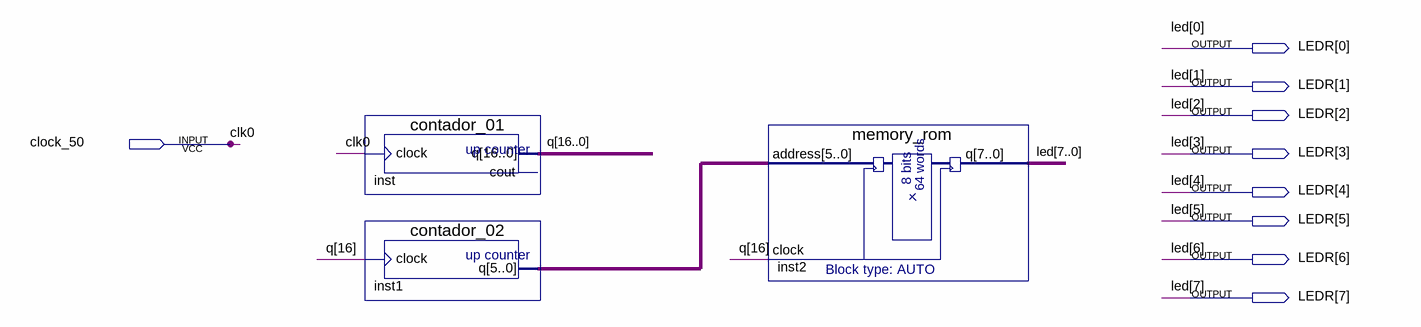
[diagram p0: schematic sheet]
// Quartus schematic lab_04A.bdf as structural Verilog: 3 symbols, 9 pins
module lab_04A (
  input  clock_50,
  output [7:0] LEDR
);

  wire [5:0] inst1_q;
  wire [16:0] q;

  contador_01 inst (.clock(clock_50), .q(q));  // open: cout
  contador_02 inst1 (.clock(q[16]), .q(inst1_q));
  memory_rom inst2 (.address(inst1_q), .clock(q[16]), .q(LEDR));

  // Other names for the same wires on the sheet: clk0 = clock_50; led[7:0] = LEDR
endmodule
